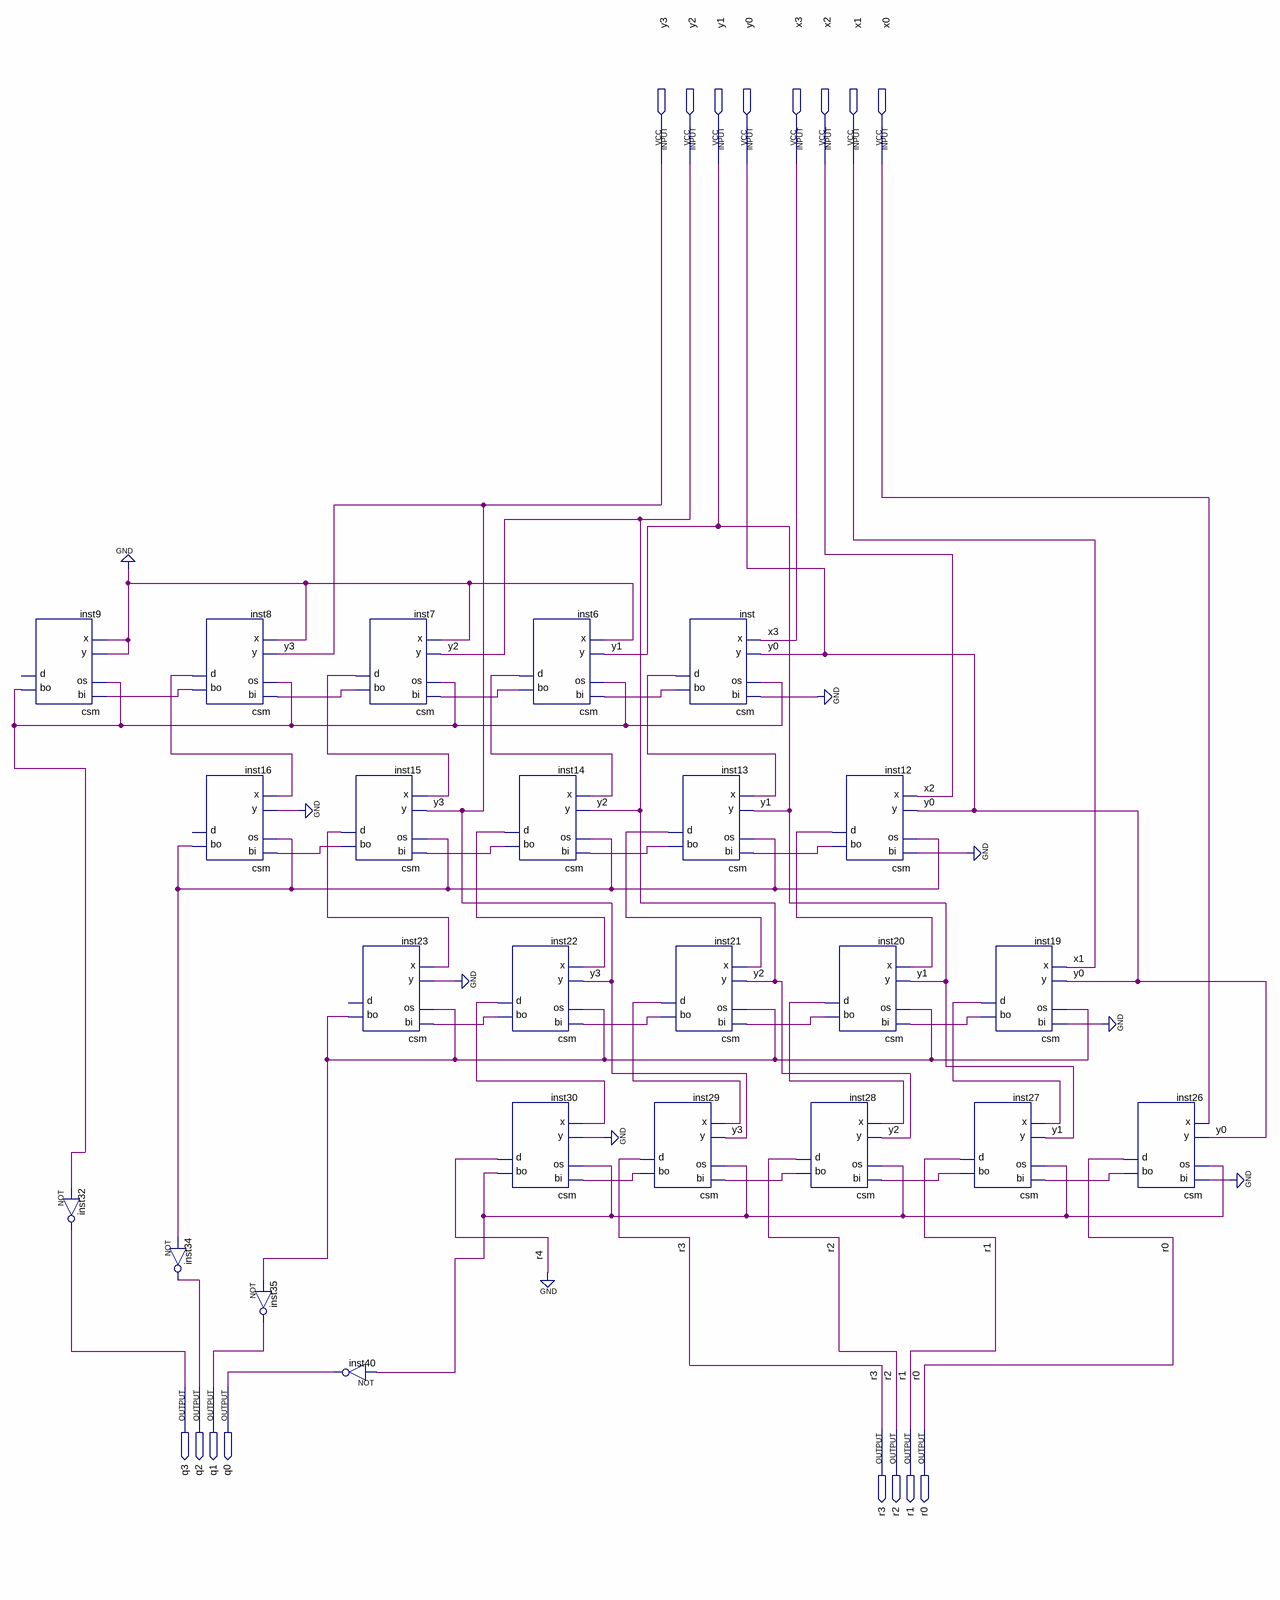
[diagram p0: schematic sheet]
// Quartus schematic new_div.bdf as structural Verilog: 24 symbols, 16 pins
module new_div (
  input  y3,
  input  y2,
  input  y1,
  input  y0,
  input  x3,
  input  x2,
  input  x1,
  input  x0,
  output q3,
  output q2,
  output q1,
  output q0,
  output r3,
  output r2,
  output r1,
  output r0
);

  wire inst6_bo, inst6_d, inst7_bo, inst7_d, inst8_bo, inst8_d, inst9_bo, inst12_bo, inst12_d, inst13_bo,
       inst13_d, inst14_bo, inst14_d, inst15_bo, inst15_d, inst16_bo, inst19_bo, inst19_d, inst20_bo,
       inst20_d, inst21_bo, inst21_d, inst22_bo, inst22_d, inst23_bo, inst26_bo, inst27_bo, inst28_bo,
       inst29_bo, inst30_bo, inst_bo, inst_d, r4;

  csm inst9 (.x(1'b0), .y(1'b0), .bi(inst8_bo), .os(inst9_bo), .bo(inst9_bo));  // open: d
  not inst32 (q3, inst9_bo);
  not inst34 (q2, inst16_bo);
  csm inst8 (.x(1'b0), .y(y3), .bi(inst7_bo), .os(inst9_bo), .bo(inst8_bo), .d(inst8_d));
  csm inst16 (.x(inst8_d), .y(1'b0), .bi(inst15_bo), .os(inst16_bo), .bo(inst16_bo));  // open: d
  not inst35 (q1, inst23_bo);
  not inst40 (q0, inst30_bo);
  csm inst7 (.x(1'b0), .y(y2), .bi(inst6_bo), .os(inst9_bo), .bo(inst7_bo), .d(inst7_d));
  csm inst15 (.x(inst7_d), .y(y3), .bi(inst14_bo), .os(inst16_bo), .bo(inst15_bo), .d(inst15_d));
  csm inst23 (.x(inst15_d), .y(1'b0), .bi(inst22_bo), .os(inst23_bo), .bo(inst23_bo));  // open: d
  csm inst14 (.x(inst6_d), .y(y2), .bi(inst13_bo), .os(inst16_bo), .bo(inst14_bo), .d(inst14_d));
  csm inst22 (.x(inst14_d), .y(y3), .bi(inst21_bo), .os(inst23_bo), .bo(inst22_bo), .d(inst22_d));
  csm inst30 (.x(inst22_d), .y(1'b0), .bi(inst29_bo), .os(inst30_bo), .bo(inst30_bo), .d(r4));
  csm inst6 (.x(1'b0), .y(y1), .bi(inst_bo), .os(inst9_bo), .bo(inst6_bo), .d(inst6_d));
  csm inst (.x(x3), .y(y0), .bi(1'b0), .os(inst9_bo), .bo(inst_bo), .d(inst_d));
  csm inst13 (.x(inst_d), .y(y1), .bi(inst12_bo), .os(inst16_bo), .bo(inst13_bo), .d(inst13_d));
  csm inst21 (.x(inst13_d), .y(y2), .bi(inst20_bo), .os(inst23_bo), .bo(inst21_bo), .d(inst21_d));
  csm inst29 (.x(inst21_d), .y(y3), .bi(inst28_bo), .os(inst30_bo), .bo(inst29_bo), .d(r3));
  csm inst12 (.x(x2), .y(y0), .bi(1'b0), .os(inst16_bo), .bo(inst12_bo), .d(inst12_d));
  csm inst20 (.x(inst12_d), .y(y1), .bi(inst19_bo), .os(inst23_bo), .bo(inst20_bo), .d(inst20_d));
  csm inst28 (.x(inst20_d), .y(y2), .bi(inst27_bo), .os(inst30_bo), .bo(inst28_bo), .d(r2));
  csm inst27 (.x(inst19_d), .y(y1), .bi(inst26_bo), .os(inst30_bo), .bo(inst27_bo), .d(r1));
  csm inst19 (.x(x1), .y(y0), .bi(1'b0), .os(inst23_bo), .bo(inst19_bo), .d(inst19_d));
  csm inst26 (.x(x0), .y(y0), .bi(1'b0), .os(inst30_bo), .bo(inst26_bo), .d(r0));
  // also tied to GND on the sheet: r4
endmodule
